# Altium schematic sheet EVO373.SchDoc
size 420 x 297 mm; SheetNumber: 1; SheetTotal: 1
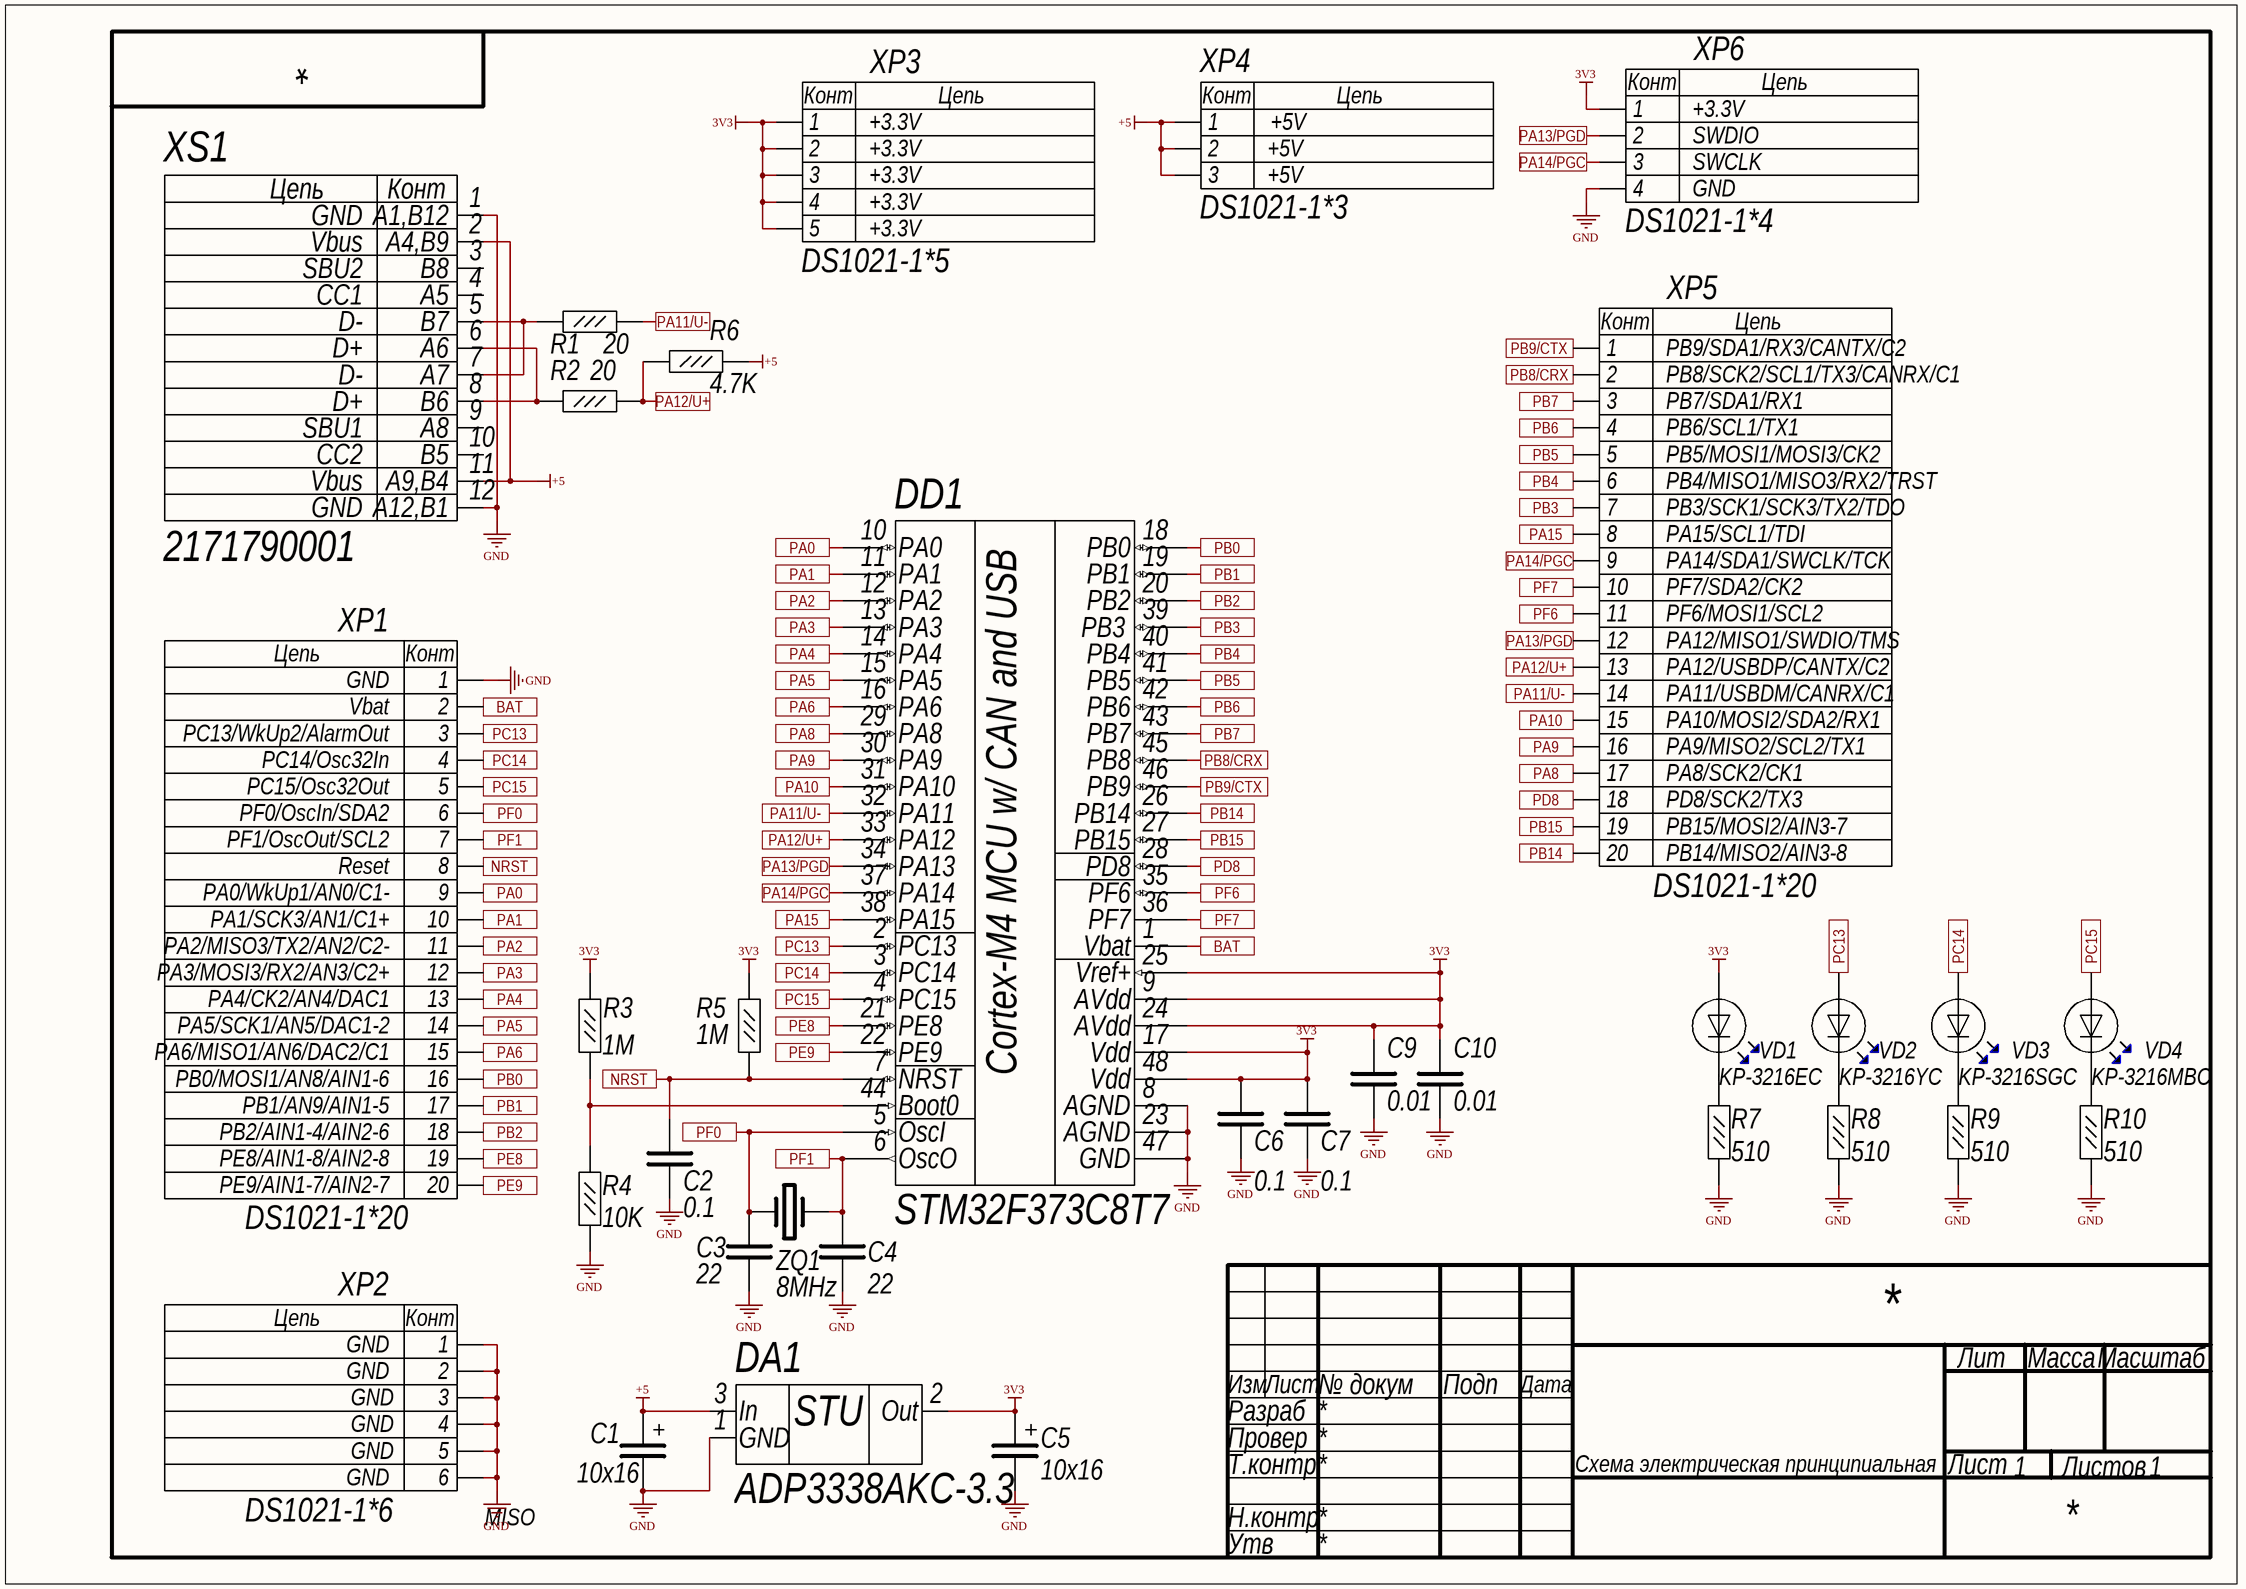
[diagram p0: EVO373.SchDoc]

## Parts
C1  10x16  [CAP-TYPEB]
C2  0.1  [CAP-CHIP0603]
C3  22  [CAP-CHIP0603]
C4  22  [CAP-CHIP0603]
C5  10x16  [CAP-TYPEB]
C6  0.1  [CAP-CHIP0603]
C7  0.1  [CAP-CHIP0603]
C9  0.01  [CAP-CHIP0603]
C10  0.01  [CAP-CHIP0603]
DA1  ADP3338AKC-3.3  [SOT223]
DD1  STM32F373C8T7  [QFP-48-7x7]
R1  20  [RES-CHIP0603]
R2  20  [RES-CHIP0603]
R3  1M  [RES-CHIP0603]
R4  10K  [RES-CHIP0603]
R5  1M  [RES-CHIP0603]
R6  4.7K  [RES-CHIP0603]
R7  510  [RES-CHIP0603]
R8  510  [RES-CHIP0603]
R9  510  [RES-CHIP0603]
R10  510  [RES-CHIP0603]
VD1  KP-3216EC  [LED1206]
VD2  KP-3216YC  [LED1206]
VD3  KP-3216SGC  [LED1206]
VD4  KP-3216MBC  [LED1206]
XP1  FullName: DS1021-1*20  [PLS-20S]  (hidden comment: PLS-20)
XP2  FullName: DS1021-1*6  [PLS-6S]  (hidden comment: GND)
XP3  FullName: DS1021-1*5  [PLS-5S]  (hidden comment: +3.3V)
XP4  FullName: DS1021-1*3  [PLS-3S]  (hidden comment: +5V)
XP5  FullName: DS1021-1*20  [PLS-20S]  (hidden comment: PLS-20)
XP6  FullName: DS1021-1*4  [PLS-4S]  (hidden comment: SWD)
XS1  2171790001  [2171790001]
ZQ1  8MHz  [ZQ-3225]

## Ports
BAT, NRST, PA0, PA1, PA2, PA3, PA4, PA5, PA6, PA8, PA9, PA10, PA11/U-, PA12/U+, PA13/PGD, PA14/PGC, PA15, PB0, PB1, PB2, PB3, PB4, PB5, PB6, PB7, PB8/CRX, PB9/CTX, PB14, PB15, PC13, PC14, PC15, PD8, PE8, PE9, PF0, PF1, PF6, PF7

## Nets
3V3: C5.1 C6.2 C7.2 C9.2 C10.2 DA1.2(Out) DD1.9(AVdd) DD1.17(Vdd) DD1.24(AVdd) DD1.25(Vref+) DD1.48(Vdd) R3.1 R5.1 VD1.1(RedAnode) XP3.1 XP3.2 XP3.3 XP3.4 XP3.5 XP6.1
+5: C1.1 DA1.3(In) R6.1 XP4.1 XP4.2 XP4.3 XS1.2(A4,B9) XS1.11(A9,B4)
GND: C1.2 C2.1 C3.1 C4.1 C5.2 C6.1 C7.1 C9.1 C10.1 DA1.1(GND) DD1.8(AGND) DD1.23(AGND) DD1.47(GND) R4.1 R7.1 R8.1 R9.1 R10.1 XP1.1 XP2.1 XP2.2 XP2.3 XP2.4 XP2.5 XP2.6 XP6.4 XS1.1(A1,B12) XS1.12(A12,B1)
BAT: DD1.1(Vbat) XP1.2 ; port BAT
NRST: C2.2 DD1.7(NRST) R5.2 XP1.8 ; port NRST
PA0: DD1.10(PA0) XP1.9 ; port PA0
PA1: DD1.11(PA1) XP1.10 ; port PA1
PA2: DD1.12(PA2) XP1.11 ; port PA2
PA3: DD1.13(PA3) XP1.12 ; port PA3
PA4: DD1.14(PA4) XP1.13 ; port PA4
PA5: DD1.15(PA5) XP1.14 ; port PA5
PA6: DD1.16(PA6) XP1.15 ; port PA6
PA8: DD1.29(PA8) XP5.17 ; port PA8
PA9: DD1.30(PA9) XP5.16 ; port PA9
PA10: DD1.31(PA10) XP5.15 ; port PA10
PA11/U-: DD1.32(PA11) R1.2 XP5.14 ; port PA11/U-
PA12/U+: DD1.33(PA12) R2.2 R6.2 XP5.13 ; port PA12/U+
PA13/PGD: DD1.34(PA13) XP5.12 XP6.2 ; port PA13/PGD
PA14/PGC: DD1.37(PA14) XP5.9 XP6.3 ; port PA14/PGC
PA15: DD1.38(PA15) XP5.8 ; port PA15
PB0: DD1.18(PB0) XP1.16 ; port PB0
PB1: DD1.19(PB1) XP1.17 ; port PB1
PB2: DD1.20(PB2) XP1.18 ; port PB2
PB3: DD1.39(PB3) XP5.7 ; port PB3
PB4: DD1.40(PB4) XP5.6 ; port PB4
PB5: DD1.41(PB5) XP5.5 ; port PB5
PB6: DD1.42(PB6) XP5.4 ; port PB6
PB7: DD1.43(PB7) XP5.3 ; port PB7
PB8/CRX: DD1.45(PB8) XP5.2 ; port PB8/CRX
PB9/CTX: DD1.46(PB9) XP5.1 ; port PB9/CTX
PB14: DD1.26(PB14) XP5.20 ; port PB14
PB15: DD1.27(PB15) XP5.19 ; port PB15
PC13: DD1.2(PC13) VD2.1(RedAnode) XP1.3 ; port PC13
PC14: DD1.3(PC14) VD3.1(RedAnode) XP1.4 ; port PC14
PC15: DD1.4(PC15) VD4.1(RedAnode) XP1.5 ; port PC15
PD8: DD1.28(PD8) XP5.18 ; port PD8
PE8: DD1.21(PE8) XP1.19 ; port PE8
PE9: DD1.22(PE9) XP1.20 ; port PE9
PF0: C3.2 DD1.5(OscI) XP1.6 ZQ1.1 ; port PF0
PF1: C4.2 DD1.6(OscO) XP1.7 ZQ1.3 ; port PF1
PF6: DD1.35(PF6) XP5.11 ; port PF6
PF7: DD1.36(PF7) XP5.10 ; port PF7
NetDD1_44: DD1.44(Boot0) R3.2 R4.2
NetR1_1: R1.1 XS1.5(B7) XS1.7(A7)
NetR2_1: R2.1 XS1.6(A6) XS1.8(B6)
NetR7_2: R7.2 VD1.2(Cathode)
NetR8_2: R8.2 VD2.2(Cathode)
NetR9_2: R9.2 VD3.2(Cathode)
NetR10_2: R10.2 VD4.2(Cathode)

Not connected (* = marked no-connect by the designer): XS1 3(B8) 4(A5) 9(A8) 10(B5)

## Notes on the sheet
- +3.3V
- +5V
- GND
- SWCLK
- SWDIO
- PB9/SDA1/RX3/CANTX/C2
- PB7/SDA1/RX1
- PB8/SCK2/SCL1/TX3/CANRX/C1
- PB5/MOSI1/MOSI3/CK2
- PB6/SCL1/TX1
- PA15/SCL1/TDI
- PB3/SCK1/SCK3/TX2/TDO
- PB4/MISO1/MISO3/RX2/TRST
- PF7/SDA2/CK2
- PA14/SDA1/SWCLK/TCK
- PA12/USBDP/CANTX/C2
- PA12/MISO1/SWDIO/TMS
- PF6/MOSI1/SCL2
- Vbat
- PC13/WkUp2/AlarmOut
- PA10/MOSI2/SDA2/RX1
- PA11/USBDM/CANRX/C1
- PC14/Osc32In
- PC15/Osc32Out
- PD8/SCK2/TX3
- PA8/SCK2/CK1
- PA9/MISO2/SCL2/TX1
- Reset
- PF0/OscIn/SDA2
- PF1/OscOut/SCL2
- PB14/MISO2/AIN3-8
- PB15/MOSI2/AIN3-7
- PA0/WkUp1/AN0/C1-
- PA1/SCK3/AN1/C1+
- PA2/MISO3/TX2/AN2/C2-
- PA3/MOSI3/RX2/AN3/C2+
- PA4/CK2/AN4/DAC1
- PA5/SCK1/AN5/DAC1-2
- PA6/MISO1/AN6/DAC2/C1
- PB2/AIN1-4/AIN2-6
- PB1/AN9/AIN1-5
- PB0/MOSI1/AN8/AIN1-6
- PE9/AIN1-7/AIN2-7
- PE8/AIN1-8/AIN2-8
- (near XP2) MISO
- Разраб
- Изм
- Лист
- № докум
- Подп
- Дата
- Лит
- Масса
- Масштаб
- Провер
- Т.контр
- Схема электрическая принципиальная
- Листов
- Н.контр
- Утв
- (in symbol 2171790001) Цепь; Конт; GND; Vbus; SBU2; CC1; D-; D+; SBU1; CC2
- (in symbol ADP3338AKC-3.3) STU
- (in symbol PLS-3) Конт; Цепь
- (in symbol PLS-4) Конт; Цепь
- (in symbol PLS-5) Конт; Цепь
- (in symbol PLS-6) Цепь; Конт
- (in symbol PLS-20) Цепь; Конт
- (in symbol STM32F373C8T7) Cortex-M4 MCU w/ CAN and USB

## Library data of the parts
C1 C5 = CAP-TypeB: Tantalum Capacitor TypeB size; Manufacturer: KEMET; TY: АЖЯР.673546.007ТУ; FullName: T491BxxxKxxxAT; ChipDip: *
C2-C4 C6 C7 C9 C10 = CAP-NP0-0603: Chip Capacitor NP0 (C0G) 0603 size; Manufacturer: KEMET; TY: АЖЯР.673511.004ТУ; FullName: C0603CxxxJxGACT; ChipDip: *
DA1 = ADP3338AKC-3.3: LDO linear 3.3V regulator; Manufacturer: Analog Devices; ChipDip: 8046220726; FullName: ADP3338AKC-3.3
DD1 = STM32F373C8T7: Cortex-M4, 12bit ADC, 12bit DAC, RTC, CAN, USB; Manufacturer: ST Microelectronics; ChipDip: 9000237665; FullName: STM32F373C8T7
R1-R10 = CHIP-0603-E24: Chip resistor 0603 E24 tolerance; Manufacturer: Bourns; TY: ШКАБ.434110.002 ТУ; FullName: CR0603-JW-; ChipDip: *
VD1 = KP-3216EC: Red LED Chip 1206; Manufacturer: Kingbright; ChipDip: 8008595251; FullName: KP-3216EC
VD2 = KP-3216YC: Yellow LED Chip 1206; Manufacturer: Kingbright; ChipDip: 8001937240; FullName: KP-3216YC
VD3 = KP-3216SGC: Green LED Chip 1206; Manufacturer: Kingbright; ChipDip: 8001779374; FullName: KP-3216SGC
VD4 = KP-3216MBC: Blue LED Chip 1206; Manufacturer: Kingbright; ChipDip: 8001946453; FullName: KP-3216MBC
XP1 XP5 = PLS-20: Plug 24pin 2mm pitch; Manufacturer: Connfly; ChipDip: 379650257
XP2 = PLS-6: Plug 6pin 2mm pitch; Manufacturer: Connfly; ChipDip: 389965514
XP3 = PLS-5: Plug 5pin 2mm pitch; Manufacturer: Connfly; ChipDip: 707998901
XP4 = PLS-3: Plug 3pin 2.54mm pitch; Manufacturer: Connfly; ChipDip: 132511368
XP6 = PLS-4: Plug 4pin 2mm pitch; Manufacturer: Connfly; ChipDip: 174993133
XS1 = 2171790001: Horizontal USB TypeC USB 2.0 compatible socket; Manufacturer: Molex; ChipDip: 8008902888; FullName: 2171790001
ZQ1 = ZQ-3225: SMD quartz generator 3.2x2/5mm; TY: {TY}; FullName: SMX